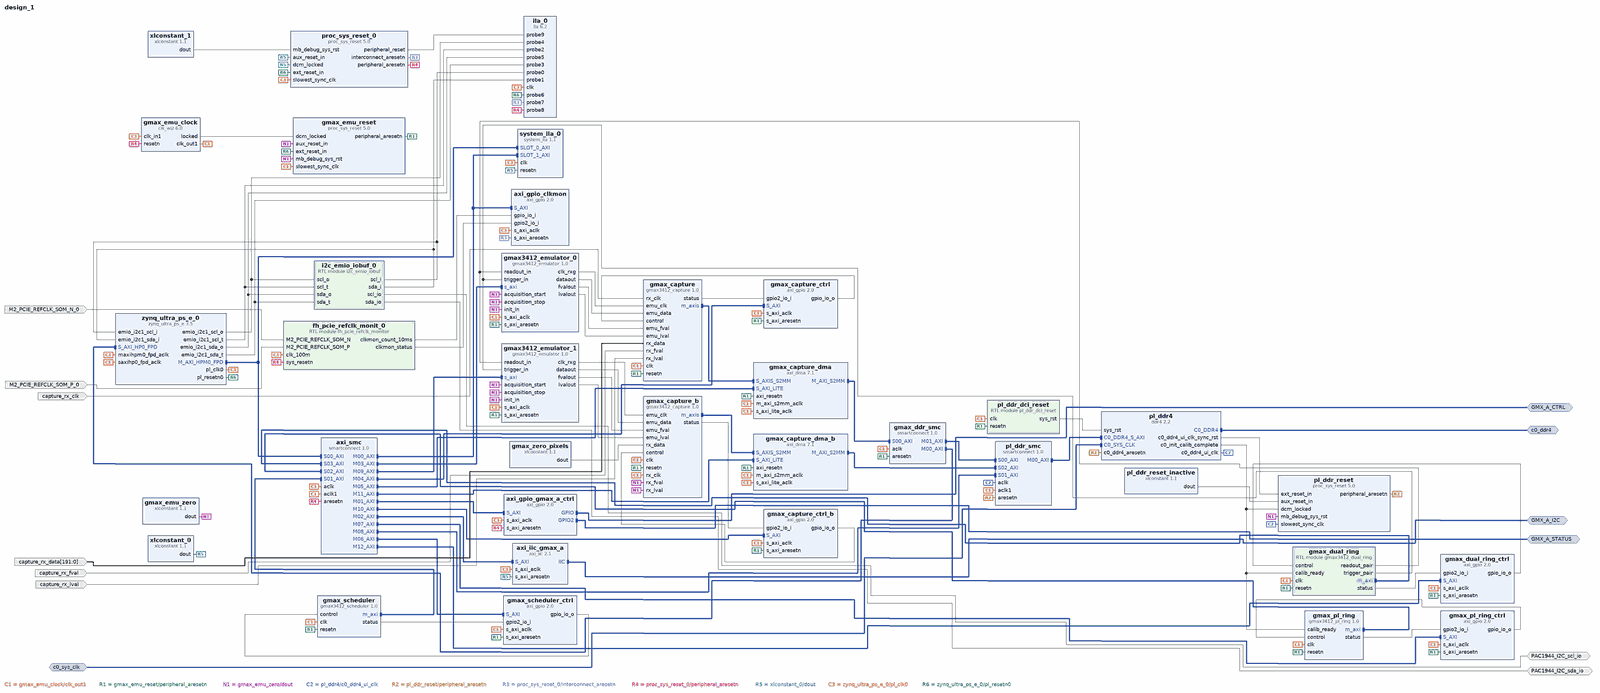
[diagram p0: block diagram of the top level, whole]
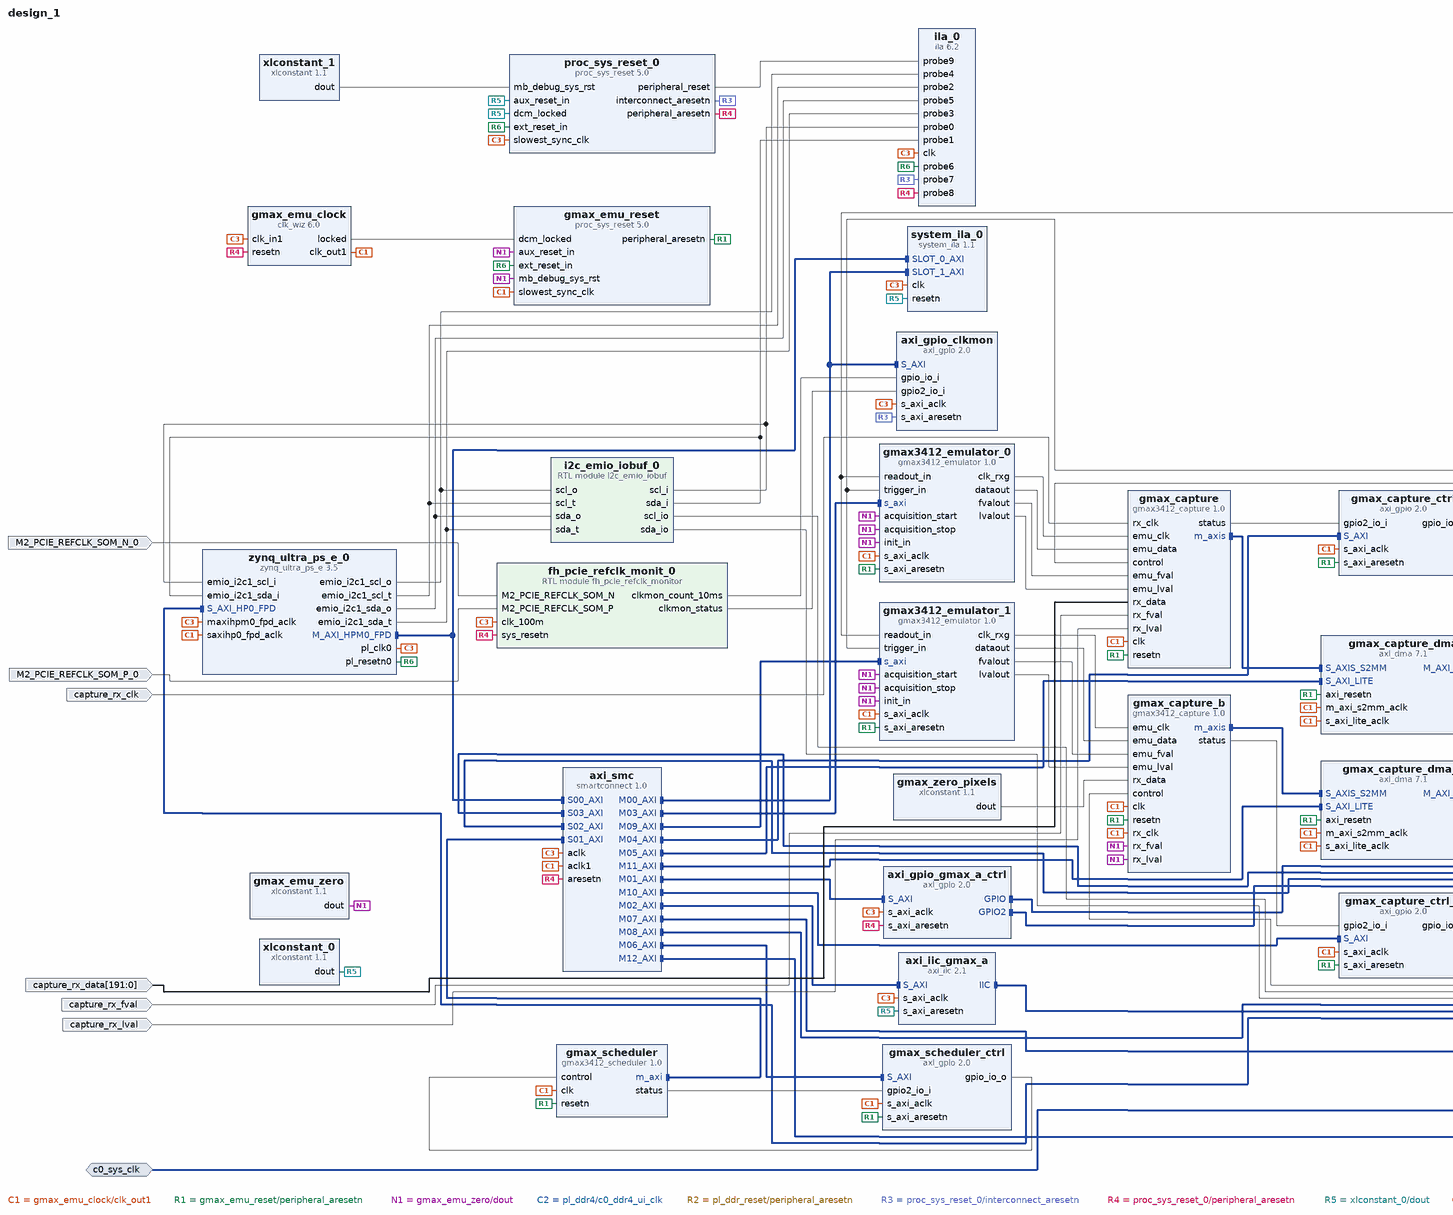
[diagram p1: block diagram of the top level, left part]
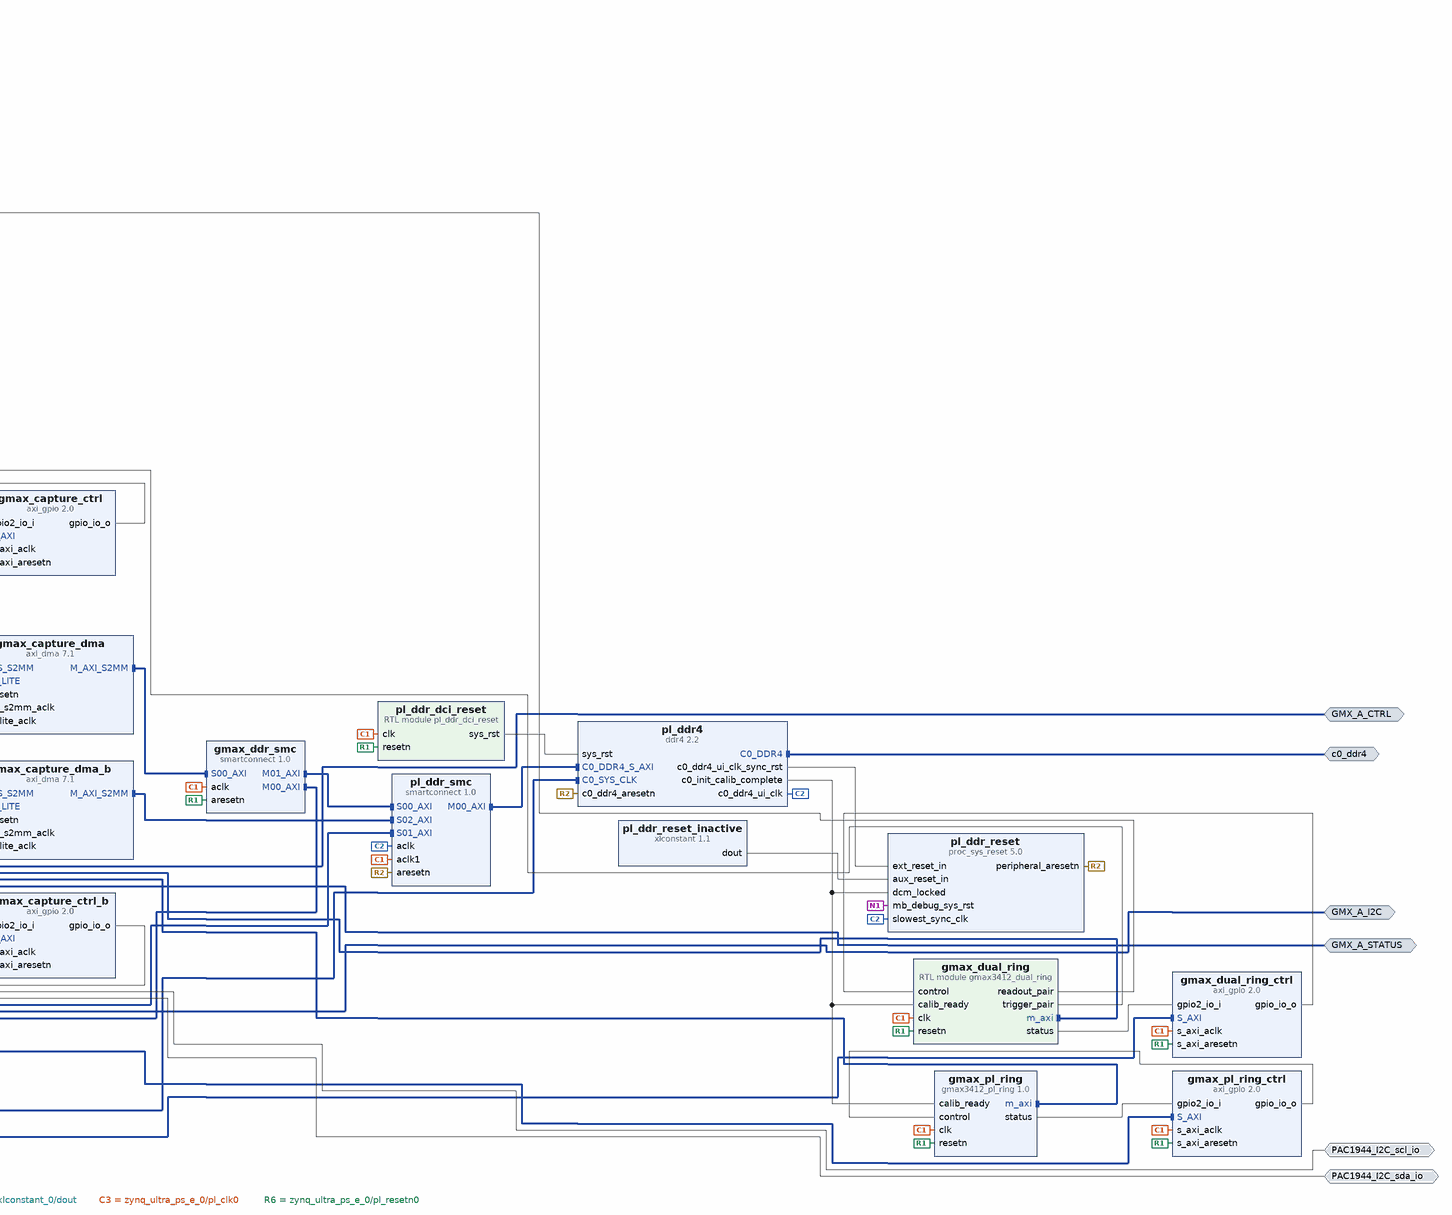
[diagram p2: block diagram of the top level, right part]
# Vivado block design design_1, xczu7ev-ffvc1156-2-i, Vivado 2025.2
create_bd_design design_1

create_bd_intf_port -mode Master -vlnv xilinx.com:interface:gpio_rtl:1.0 GMX_A_CTRL
create_bd_intf_port -mode Master -vlnv xilinx.com:interface:gpio_rtl:1.0 GMX_A_STATUS
create_bd_intf_port -mode Master -vlnv xilinx.com:interface:iic_rtl:1.0 GMX_A_I2C
create_bd_intf_port -mode Master -vlnv xilinx.com:interface:ddr4_rtl:1.0 c0_ddr4
create_bd_intf_port -mode Slave -vlnv xilinx.com:interface:diff_clock_rtl:1.0 c0_sys_clk
set_property -dict {CONFIG.FREQ_HZ 200080032} [get_bd_intf_ports c0_sys_clk]
create_bd_port -dir IO PAC1944_I2C_scl_io
create_bd_port -dir IO PAC1944_I2C_sda_io
create_bd_port -dir I M2_PCIE_REFCLK_SOM_P_0
create_bd_port -dir I M2_PCIE_REFCLK_SOM_N_0
create_bd_port -dir I -type clk capture_rx_clk
set_property -dict {CONFIG.FREQ_HZ 120000000} [get_bd_ports capture_rx_clk]
create_bd_port -dir I -type data capture_rx_fval
create_bd_port -dir I -type data capture_rx_lval
create_bd_port -dir I -from 191 -to 0 capture_rx_data

create_bd_cell -type ip -vlnv xilinx.com:ip:zynq_ultra_ps_e:3.5 zynq_ultra_ps_e_0
set_property -dict [list \
  CONFIG.CAN0_BOARD_INTERFACE custom \
  CONFIG.CAN1_BOARD_INTERFACE custom \
  CONFIG.CSU_BOARD_INTERFACE custom \
  CONFIG.DP_BOARD_INTERFACE custom \
  CONFIG.GEM0_BOARD_INTERFACE custom \
  CONFIG.GEM1_BOARD_INTERFACE custom \
  CONFIG.GEM2_BOARD_INTERFACE custom \
  CONFIG.GEM3_BOARD_INTERFACE custom \
  CONFIG.GPIO_BOARD_INTERFACE custom \
  CONFIG.IIC0_BOARD_INTERFACE custom \
  CONFIG.IIC1_BOARD_INTERFACE custom \
  CONFIG.NAND_BOARD_INTERFACE custom \
  CONFIG.PCIE_BOARD_INTERFACE custom \
  CONFIG.PJTAG_BOARD_INTERFACE custom \
  CONFIG.PMU_BOARD_INTERFACE custom \
  CONFIG.PSU_BANK_0_IO_STANDARD LVCMOS18 \
  CONFIG.PSU_BANK_1_IO_STANDARD LVCMOS18 \
  CONFIG.PSU_BANK_2_IO_STANDARD LVCMOS18 \
  CONFIG.PSU_BANK_3_IO_STANDARD LVCMOS18 \
  CONFIG.PSU_USB3__DUAL_CLOCK_ENABLE 1 \
  CONFIG.PSU__ACPU2__POWER__ON 0 \
  CONFIG.PSU__ACPU3__POWER__ON 0 \
  CONFIG.PSU__CAN1__PERIPHERAL__ENABLE 0 \
  CONFIG.PSU__CRF_APB__ACPU_CTRL__FREQMHZ 1200 \
  CONFIG.PSU__CRF_APB__ACPU_CTRL__SRCSEL APLL \
  CONFIG.PSU__CRF_APB__APLL_CTRL__SRCSEL PSS_REF_CLK \
  CONFIG.PSU__CRF_APB__DBG_FPD_CTRL__FREQMHZ 250 \
  CONFIG.PSU__CRF_APB__DBG_FPD_CTRL__SRCSEL IOPLL \
  CONFIG.PSU__CRF_APB__DBG_TRACE_CTRL__FREQMHZ 250 \
  CONFIG.PSU__CRF_APB__DBG_TRACE_CTRL__SRCSEL IOPLL \
  CONFIG.PSU__CRF_APB__DBG_TSTMP_CTRL__FREQMHZ 250 \
  CONFIG.PSU__CRF_APB__DBG_TSTMP_CTRL__SRCSEL IOPLL \
  CONFIG.PSU__CRF_APB__DDR_CTRL__FREQMHZ 1200 \
  CONFIG.PSU__CRF_APB__DDR_CTRL__SRCSEL DPLL \
  CONFIG.PSU__CRF_APB__DPDMA_REF_CTRL__FREQMHZ 600 \
  CONFIG.PSU__CRF_APB__DPDMA_REF_CTRL__SRCSEL DPLL \
  CONFIG.PSU__CRF_APB__DPLL_CTRL__SRCSEL PSS_REF_CLK \
  CONFIG.PSU__CRF_APB__DP_AUDIO_REF_CTRL__SRCSEL RPLL \
  CONFIG.PSU__CRF_APB__DP_STC_REF_CTRL__SRCSEL DPLL \
  CONFIG.PSU__CRF_APB__DP_VIDEO_REF_CTRL__SRCSEL VPLL \
  CONFIG.PSU__CRF_APB__GDMA_REF_CTRL__FREQMHZ 600 \
  CONFIG.PSU__CRF_APB__GDMA_REF_CTRL__SRCSEL DPLL \
  CONFIG.PSU__CRF_APB__GPU_REF_CTRL__FREQMHZ 600 \
  CONFIG.PSU__CRF_APB__GPU_REF_CTRL__SRCSEL DPLL \
  CONFIG.PSU__CRF_APB__TOPSW_LSBUS_CTRL__FREQMHZ 100 \
  CONFIG.PSU__CRF_APB__TOPSW_LSBUS_CTRL__SRCSEL IOPLL \
  CONFIG.PSU__CRF_APB__TOPSW_MAIN_CTRL__FREQMHZ 533.333 \
  CONFIG.PSU__CRF_APB__TOPSW_MAIN_CTRL__SRCSEL APLL \
  CONFIG.PSU__CRF_APB__VPLL_CTRL__SRCSEL PSS_REF_CLK \
  CONFIG.PSU__CRL_APB__ADMA_REF_CTRL__FREQMHZ 500 \
  CONFIG.PSU__CRL_APB__ADMA_REF_CTRL__SRCSEL IOPLL \
  CONFIG.PSU__CRL_APB__CAN1_REF_CTRL__FREQMHZ 100 \
  CONFIG.PSU__CRL_APB__CAN1_REF_CTRL__SRCSEL IOPLL \
  CONFIG.PSU__CRL_APB__CPU_R5_CTRL__FREQMHZ 500 \
  CONFIG.PSU__CRL_APB__CPU_R5_CTRL__SRCSEL IOPLL \
  CONFIG.PSU__CRL_APB__DBG_LPD_CTRL__FREQMHZ 250 \
  CONFIG.PSU__CRL_APB__DBG_LPD_CTRL__SRCSEL IOPLL \
  CONFIG.PSU__CRL_APB__GEM3_REF_CTRL__FREQMHZ 125 \
  CONFIG.PSU__CRL_APB__GEM3_REF_CTRL__SRCSEL IOPLL \
  CONFIG.PSU__CRL_APB__I2C0_REF_CTRL__FREQMHZ 100 \
  CONFIG.PSU__CRL_APB__I2C0_REF_CTRL__SRCSEL IOPLL \
  CONFIG.PSU__CRL_APB__I2C1_REF_CTRL__FREQMHZ 100 \
  CONFIG.PSU__CRL_APB__I2C1_REF_CTRL__SRCSEL IOPLL \
  CONFIG.PSU__CRL_APB__IOPLL_CTRL__SRCSEL PSS_REF_CLK \
  CONFIG.PSU__CRL_APB__IOU_SWITCH_CTRL__FREQMHZ 267 \
  CONFIG.PSU__CRL_APB__IOU_SWITCH_CTRL__SRCSEL RPLL \
  CONFIG.PSU__CRL_APB__LPD_LSBUS_CTRL__FREQMHZ 100 \
  CONFIG.PSU__CRL_APB__LPD_LSBUS_CTRL__SRCSEL IOPLL \
  CONFIG.PSU__CRL_APB__LPD_SWITCH_CTRL__FREQMHZ 500 \
  CONFIG.PSU__CRL_APB__LPD_SWITCH_CTRL__SRCSEL IOPLL \
  CONFIG.PSU__CRL_APB__PCAP_CTRL__FREQMHZ 200 \
  CONFIG.PSU__CRL_APB__PCAP_CTRL__SRCSEL IOPLL \
  CONFIG.PSU__CRL_APB__PL0_REF_CTRL__FREQMHZ 100 \
  CONFIG.PSU__CRL_APB__PL0_REF_CTRL__SRCSEL RPLL \
  CONFIG.PSU__CRL_APB__QSPI_REF_CTRL__FREQMHZ 125 \
  CONFIG.PSU__CRL_APB__QSPI_REF_CTRL__SRCSEL IOPLL \
  CONFIG.PSU__CRL_APB__RPLL_CTRL__SRCSEL PSS_REF_CLK \
  CONFIG.PSU__CRL_APB__SDIO0_REF_CTRL__FREQMHZ 100 \
  CONFIG.PSU__CRL_APB__SDIO0_REF_CTRL__SRCSEL IOPLL \
  CONFIG.PSU__CRL_APB__SDIO1_REF_CTRL__FREQMHZ 100 \
  CONFIG.PSU__CRL_APB__SDIO1_REF_CTRL__SRCSEL IOPLL \
  CONFIG.PSU__CRL_APB__TIMESTAMP_REF_CTRL__FREQMHZ 100 \
  CONFIG.PSU__CRL_APB__TIMESTAMP_REF_CTRL__SRCSEL PSS_REF_CLK \
  CONFIG.PSU__CRL_APB__UART0_REF_CTRL__FREQMHZ 100 \
  CONFIG.PSU__CRL_APB__UART0_REF_CTRL__SRCSEL IOPLL \
  CONFIG.PSU__CRL_APB__UART1_REF_CTRL__FREQMHZ 100 \
  CONFIG.PSU__CRL_APB__UART1_REF_CTRL__SRCSEL IOPLL \
  CONFIG.PSU__CRL_APB__USB0_BUS_REF_CTRL__FREQMHZ 250 \
  CONFIG.PSU__CRL_APB__USB0_BUS_REF_CTRL__SRCSEL IOPLL \
  CONFIG.PSU__CRL_APB__USB3_DUAL_REF_CTRL__FREQMHZ 20 \
  CONFIG.PSU__CRL_APB__USB3_DUAL_REF_CTRL__SRCSEL IOPLL \
  CONFIG.PSU__CRL_APB__USB3__ENABLE 1 \
  CONFIG.PSU__CSUPMU__PERIPHERAL__VALID 0 \
  CONFIG.PSU__DDRC__BUS_WIDTH {64 Bit} \
  CONFIG.PSU__DDRC__COMPONENTS Components \
  CONFIG.PSU__DDRC__DEVICE_CAPACITY {8192 MBits} \
  CONFIG.PSU__DDRC__DRAM_WIDTH {16 Bits} \
  CONFIG.PSU__DDRC__ECC Disabled \
  CONFIG.PSU__DDRC__MEMORY_TYPE {DDR 4} \
  CONFIG.PSU__DDRC__SPEED_BIN DDR4_2400P \
  CONFIG.PSU__DDR_HIGH_ADDRESS_GUI_ENABLE 1 \
  CONFIG.PSU__DDR__INTERFACE__FREQMHZ 600.000 \
  CONFIG.PSU__DEVICE_TYPE EV \
  CONFIG.PSU__DISPLAYPORT__PERIPHERAL__ENABLE 0 \
  CONFIG.PSU__DLL__ISUSED 1 \
  CONFIG.PSU__ENET0__GRP_MDIO__ENABLE 1 \
  CONFIG.PSU__ENET0__GRP_MDIO__IO {MIO 76 .. 77} \
  CONFIG.PSU__ENET0__PERIPHERAL__ENABLE 1 \
  CONFIG.PSU__ENET0__PERIPHERAL__IO {MIO 26 .. 37} \
  CONFIG.PSU__ENET3__PERIPHERAL__ENABLE 0 \
  CONFIG.PSU__FPD_SLCR__WDT1__FREQMHZ 100 \
  CONFIG.PSU__FPGA_PL0_ENABLE 1 \
  CONFIG.PSU__GEM__TSU__ENABLE 0 \
  CONFIG.PSU__GPIO0_MIO__PERIPHERAL__ENABLE 0 \
  CONFIG.PSU__GPIO1_MIO__IO {MIO 26 .. 51} \
  CONFIG.PSU__GPIO1_MIO__PERIPHERAL__ENABLE 1 \
  CONFIG.PSU__GPIO2_MIO__IO {MIO 52 .. 77} \
  CONFIG.PSU__GPIO2_MIO__PERIPHERAL__ENABLE 1 \
  CONFIG.PSU__GPIO_EMIO_WIDTH 95 \
  CONFIG.PSU__GPU_PP0__POWER__ON 0 \
  CONFIG.PSU__GPU_PP1__POWER__ON 0 \
  CONFIG.PSU__I2C0__PERIPHERAL__ENABLE 1 \
  CONFIG.PSU__I2C0__PERIPHERAL__IO {MIO 74 .. 75} \
  CONFIG.PSU__I2C1__PERIPHERAL__ENABLE 1 \
  CONFIG.PSU__I2C1__PERIPHERAL__IO EMIO \
  CONFIG.PSU__IOU_SLCR__IOU_TTC_APB_CLK__TTC0_SEL APB \
  CONFIG.PSU__IOU_SLCR__IOU_TTC_APB_CLK__TTC1_SEL APB \
  CONFIG.PSU__IOU_SLCR__IOU_TTC_APB_CLK__TTC2_SEL APB \
  CONFIG.PSU__IOU_SLCR__IOU_TTC_APB_CLK__TTC3_SEL APB \
  CONFIG.PSU__IOU_SLCR__WDT0__FREQMHZ 100 \
  CONFIG.PSU__IRQ_P2F_USB2_OTG__INT0 0 \
  CONFIG.PSU__IRQ_P2F_USB2_OTG__INT1 0 \
  CONFIG.PSU__LPD_SLCR__CSUPMU__FREQMHZ 100 \
  CONFIG.PSU__MAXIGP0__DATA_WIDTH 32 \
  CONFIG.PSU__OVERRIDE_HPX_QOS 0 \
  CONFIG.PSU__OVERRIDE__BASIC_CLOCK 0 \
  CONFIG.PSU__PCIE__CLASS_CODE_BASE 0x06 \
  CONFIG.PSU__PCIE__CLASS_CODE_INTERFACE 0x0 \
  CONFIG.PSU__PCIE__CLASS_CODE_SUB 0x04 \
  CONFIG.PSU__PCIE__DEVICE_ID 0xD011 \
  CONFIG.PSU__PCIE__INTX_GENERATION 1 \
  CONFIG.PSU__PCIE__REVISION_ID 0x0 \
  CONFIG.PSU__PCIE__SUBSYSTEM_ID 0x7 \
  CONFIG.PSU__PCIE__SUBSYSTEM_VENDOR_ID 0x10EE \
  CONFIG.PSU__PCIE__VENDOR_ID 0x10EE \
  CONFIG.PSU__PMU__PERIPHERAL__ENABLE 0 \
  CONFIG.PSU__PRESET_APPLIED 0 \
  CONFIG.PSU__PSS_REF_CLK__FREQMHZ 33.333333 \
  CONFIG.PSU__QSPI_COHERENCY 0 \
  CONFIG.PSU__QSPI_ROUTE_THROUGH_FPD 0 \
  CONFIG.PSU__QSPI__GRP_FBCLK__ENABLE 0 \
  CONFIG.PSU__QSPI__PERIPHERAL__DATA_MODE x4 \
  CONFIG.PSU__QSPI__PERIPHERAL__ENABLE 1 \
  CONFIG.PSU__QSPI__PERIPHERAL__IO {MIO 0 .. 5} \
  CONFIG.PSU__QSPI__PERIPHERAL__MODE Single \
  CONFIG.PSU__SATA__LANE0__ENABLE 1 \
  CONFIG.PSU__SATA__LANE0__IO {GT Lane0} \
  CONFIG.PSU__SATA__LANE1__ENABLE 0 \
  CONFIG.PSU__SATA__PERIPHERAL__ENABLE 1 \
  CONFIG.PSU__SATA__REF_CLK_FREQ 150 \
  CONFIG.PSU__SATA__REF_CLK_SEL {Ref Clk0} \
  CONFIG.PSU__SD0__CLK_200_SDR_OTAP_DLY 0x3 \
  CONFIG.PSU__SD0__CLK_50_DDR_ITAP_DLY 0x12 \
  CONFIG.PSU__SD0__CLK_50_DDR_OTAP_DLY 0x6 \
  CONFIG.PSU__SD0__CLK_50_SDR_ITAP_DLY 0x15 \
  CONFIG.PSU__SD0__CLK_50_SDR_OTAP_DLY 0x6 \
  CONFIG.PSU__SD0__DATA_TRANSFER_MODE 8Bit \
  CONFIG.PSU__SD0__GRP_POW__ENABLE 1 \
  CONFIG.PSU__SD0__GRP_POW__IO {MIO 23} \
  CONFIG.PSU__SD0__PERIPHERAL__ENABLE 1 \
  CONFIG.PSU__SD0__PERIPHERAL__IO {MIO 13 .. 22} \
  CONFIG.PSU__SD0__RESET__ENABLE 1 \
  CONFIG.PSU__SD0__SLOT_TYPE eMMC \
  CONFIG.PSU__SD1__CLK_100_SDR_OTAP_DLY 0x0 \
  CONFIG.PSU__SD1__CLK_200_SDR_OTAP_DLY 0x0 \
  CONFIG.PSU__SD1__CLK_50_DDR_ITAP_DLY 0x0 \
  CONFIG.PSU__SD1__CLK_50_DDR_OTAP_DLY 0x0 \
  CONFIG.PSU__SD1__CLK_50_SDR_ITAP_DLY 0x15 \
  CONFIG.PSU__SD1__CLK_50_SDR_OTAP_DLY 0x5 \
  CONFIG.PSU__SD1__PERIPHERAL__ENABLE 0 \
  CONFIG.PSU__SWDT0__PERIPHERAL__ENABLE 0 \
  CONFIG.PSU__SWDT1__PERIPHERAL__ENABLE 0 \
  CONFIG.PSU__TSU__BUFG_PORT_PAIR 0 \
  CONFIG.PSU__TTC0__CLOCK__ENABLE 0 \
  CONFIG.PSU__TTC0__PERIPHERAL__ENABLE 1 \
  CONFIG.PSU__TTC0__WAVEOUT__ENABLE 0 \
  CONFIG.PSU__TTC1__CLOCK__ENABLE 0 \
  CONFIG.PSU__TTC1__PERIPHERAL__ENABLE 1 \
  CONFIG.PSU__TTC1__WAVEOUT__ENABLE 0 \
  CONFIG.PSU__TTC2__CLOCK__ENABLE 0 \
  CONFIG.PSU__TTC2__PERIPHERAL__ENABLE 1 \
  CONFIG.PSU__TTC2__WAVEOUT__ENABLE 0 \
  CONFIG.PSU__TTC3__CLOCK__ENABLE 0 \
  CONFIG.PSU__TTC3__PERIPHERAL__ENABLE 1 \
  CONFIG.PSU__TTC3__WAVEOUT__ENABLE 0 \
  CONFIG.PSU__UART0__BAUD_RATE 115200 \
  CONFIG.PSU__UART0__MODEM__ENABLE 0 \
  CONFIG.PSU__UART0__PERIPHERAL__ENABLE 1 \
  CONFIG.PSU__UART0__PERIPHERAL__IO {MIO 42 .. 43} \
  CONFIG.PSU__UART1__PERIPHERAL__ENABLE 0 \
  CONFIG.PSU__USB0_COHERENCY 0 \
  CONFIG.PSU__USB0__PERIPHERAL__ENABLE 1 \
  CONFIG.PSU__USB0__PERIPHERAL__IO {MIO 52 .. 63} \
  CONFIG.PSU__USB0__REF_CLK_FREQ 100 \
  CONFIG.PSU__USB0__REF_CLK_SEL {Ref Clk1} \
  CONFIG.PSU__USB2_0__EMIO__ENABLE 0 \
  CONFIG.PSU__USB3_0__EMIO__ENABLE 0 \
  CONFIG.PSU__USB3_0__PERIPHERAL__ENABLE 1 \
  CONFIG.PSU__USB3_0__PERIPHERAL__IO {GT Lane1} \
  CONFIG.PSU__USB__RESET__MODE {Boot Pin} \
  CONFIG.PSU__USB__RESET__POLARITY {Active Low} \
  CONFIG.PSU__USE__IRQ0 0 \
  CONFIG.PSU__USE__M_AXI_GP0 1 \
  CONFIG.PSU__USE__M_AXI_GP1 0 \
  CONFIG.PSU__USE__M_AXI_GP2 0 \
  CONFIG.PSU__USE__S_AXI_GP2 1 \
  CONFIG.QSPI_BOARD_INTERFACE custom \
  CONFIG.SATA_BOARD_INTERFACE custom \
  CONFIG.SD0_BOARD_INTERFACE custom \
  CONFIG.SD1_BOARD_INTERFACE custom \
  CONFIG.SPI0_BOARD_INTERFACE custom \
  CONFIG.SPI1_BOARD_INTERFACE custom \
  CONFIG.SUBPRESET1 Custom \
  CONFIG.SUBPRESET2 Custom \
  CONFIG.SWDT0_BOARD_INTERFACE custom \
  CONFIG.SWDT1_BOARD_INTERFACE custom \
  CONFIG.TRACE_BOARD_INTERFACE custom \
  CONFIG.TTC0_BOARD_INTERFACE custom \
  CONFIG.TTC1_BOARD_INTERFACE custom \
  CONFIG.TTC2_BOARD_INTERFACE custom \
  CONFIG.TTC3_BOARD_INTERFACE custom \
  CONFIG.UART0_BOARD_INTERFACE custom \
  CONFIG.UART1_BOARD_INTERFACE custom \
  CONFIG.USB0_BOARD_INTERFACE custom \
  CONFIG.USB1_BOARD_INTERFACE custom \
  CONFIG.preset None \
] [get_bd_cells zynq_ultra_ps_e_0]
# 763 more settings of zynq_ultra_ps_e_0 are not shown: defaults, MIO pin electricals, DDR timing, and values the tool derives
create_bd_cell -type ip -vlnv xilinx.com:ip:ila:6.2 ila_0
set_property -dict {CONFIG.C_DATA_DEPTH 65536 CONFIG.C_MONITOR_TYPE Native CONFIG.C_NUM_OF_PROBES 10} [get_bd_cells ila_0]
create_bd_cell -type module -reference i2c_emio_iobuf i2c_emio_iobuf_0
create_bd_cell -type module -reference fh_pcie_refclk_monitor fh_pcie_refclk_monit_0
create_bd_cell -type ip -vlnv xilinx.com:ip:proc_sys_reset:5.0 proc_sys_reset_0
set_property -dict [list \
  CONFIG.C_AUX_RST_WIDTH 1 \
  CONFIG.C_NUM_INTERCONNECT_ARESETN 1 \
  CONFIG.C_NUM_PERP_RST 1 \
] [get_bd_cells proc_sys_reset_0]
create_bd_cell -type ip -vlnv xilinx.com:ip:axi_gpio:2.0 axi_gpio_clkmon
set_property -dict {CONFIG.C_ALL_INPUTS 1 CONFIG.C_ALL_INPUTS_2 1 CONFIG.C_IS_DUAL 1} [get_bd_cells axi_gpio_clkmon]
create_bd_cell -type ip -vlnv xilinx.com:ip:smartconnect:1.0 axi_smc
set_property -dict {CONFIG.NUM_CLKS 2 CONFIG.NUM_MI 13 CONFIG.NUM_SI 4} [get_bd_cells axi_smc]
create_bd_cell -type ip -vlnv xilinx.com:ip:xlconstant:1.1 xlconstant_0
set_property -dict {CONFIG.CONST_VAL 1} [get_bd_cells xlconstant_0]
create_bd_cell -type ip -vlnv xilinx.com:ip:xlconstant:1.1 xlconstant_1
set_property -dict {CONFIG.CONST_VAL 0} [get_bd_cells xlconstant_1]
create_bd_cell -type ip -vlnv xilinx.com:ip:system_ila:1.1 system_ila_0
set_property -dict [list \
  CONFIG.C_ADV_TRIGGER false \
  CONFIG.C_DATA_DEPTH 4096 \
  CONFIG.C_EN_STRG_QUAL 0 \
  CONFIG.C_NUM_MONITOR_SLOTS 2 \
  CONFIG.C_SLOT 1 \
] [get_bd_cells system_ila_0]
create_bd_cell -type ip -vlnv xilinx.com:ip:axi_gpio:2.0 axi_gpio_gmax_a_ctrl
set_property -dict [list \
  CONFIG.C_ALL_INPUTS_2 1 \
  CONFIG.C_ALL_OUTPUTS 1 \
  CONFIG.C_DOUT_DEFAULT 0x00000008 \
  CONFIG.C_GPIO2_WIDTH 32 \
  CONFIG.C_GPIO_WIDTH 15 \
  CONFIG.C_IS_DUAL 1 \
] [get_bd_cells axi_gpio_gmax_a_ctrl]
create_bd_cell -type ip -vlnv xilinx.com:ip:axi_iic:2.1 axi_iic_gmax_a
create_bd_cell -type ip -vlnv fh.local:user:gmax3412_emulator:1.0 gmax3412_emulator_0
set_property -dict {CONFIG.LANES 16} [get_bd_cells gmax3412_emulator_0]
create_bd_cell -type ip -vlnv xilinx.com:ip:clk_wiz:6.0 gmax_emu_clock
set_property -dict [list \
  CONFIG.CLKOUT1_REQUESTED_OUT_FREQ 120.000 \
  CONFIG.PRIM_IN_FREQ 100.000 \
  CONFIG.PRIM_SOURCE No_buffer \
  CONFIG.RESET_TYPE ACTIVE_LOW \
] [get_bd_cells gmax_emu_clock]
create_bd_cell -type ip -vlnv xilinx.com:ip:proc_sys_reset:5.0 gmax_emu_reset
set_property -dict {CONFIG.C_AUX_RESET_HIGH 1} [get_bd_cells gmax_emu_reset]
create_bd_cell -type ip -vlnv xilinx.com:ip:xlconstant:1.1 gmax_emu_zero
set_property -dict {CONFIG.CONST_VAL 0} [get_bd_cells gmax_emu_zero]
create_bd_cell -type ip -vlnv fh.local:user:gmax3412_capture:1.0 gmax_capture
set_property -dict {CONFIG.AXIS_WIDTH 256 CONFIG.DEPTH 4096 CONFIG.LANES 16} [get_bd_cells gmax_capture]
create_bd_cell -type ip -vlnv xilinx.com:ip:axi_gpio:2.0 gmax_capture_ctrl
set_property -dict [list \
  CONFIG.C_ALL_INPUTS_2 1 \
  CONFIG.C_ALL_OUTPUTS 1 \
  CONFIG.C_GPIO2_WIDTH 32 \
  CONFIG.C_GPIO_WIDTH 32 \
  CONFIG.C_IS_DUAL 1 \
] [get_bd_cells gmax_capture_ctrl]
create_bd_cell -type ip -vlnv xilinx.com:ip:axi_dma:7.1 gmax_capture_dma
set_property -dict [list \
  CONFIG.c_addr_width 64 \
  CONFIG.c_include_mm2s 0 \
  CONFIG.c_include_s2mm 1 \
  CONFIG.c_include_sg 0 \
  CONFIG.c_m_axi_s2mm_data_width 256 \
  CONFIG.c_s2mm_burst_size 64 \
  CONFIG.c_s_axis_s2mm_tdata_width 256 \
  CONFIG.c_sg_length_width 26 \
] [get_bd_cells gmax_capture_dma]
create_bd_cell -type ip -vlnv xilinx.com:ip:smartconnect:1.0 gmax_ddr_smc
set_property -dict {CONFIG.NUM_MI 2 CONFIG.NUM_SI 1} [get_bd_cells gmax_ddr_smc]
create_bd_cell -type ip -vlnv fh.local:user:gmax3412_scheduler:1.0 gmax_scheduler
create_bd_cell -type ip -vlnv xilinx.com:ip:axi_gpio:2.0 gmax_scheduler_ctrl
set_property -dict [list \
  CONFIG.C_ALL_INPUTS_2 1 \
  CONFIG.C_ALL_OUTPUTS 1 \
  CONFIG.C_GPIO2_WIDTH 32 \
  CONFIG.C_GPIO_WIDTH 32 \
  CONFIG.C_IS_DUAL 1 \
] [get_bd_cells gmax_scheduler_ctrl]
create_bd_cell -type ip -vlnv xilinx.com:ip:ddr4:2.2 pl_ddr4
set_property -dict [list \
  CONFIG.C0.DDR4_AxiAddressWidth 32 \
  CONFIG.C0.DDR4_AxiDataWidth 512 \
  CONFIG.C0.DDR4_AxiNarrowBurst true \
  CONFIG.C0.DDR4_CasLatency 17 \
  CONFIG.C0.DDR4_CasWriteLatency 12 \
  CONFIG.C0.DDR4_DataMask DM_NO_DBI \
  CONFIG.C0.DDR4_DataWidth 64 \
  CONFIG.C0.DDR4_InputClockPeriod 4998 \
  CONFIG.C0.DDR4_MemoryPart MT40A512M16LY-075 \
  CONFIG.C0.DDR4_TimePeriod 833 \
] [get_bd_cells pl_ddr4]
create_bd_cell -type ip -vlnv xilinx.com:ip:proc_sys_reset:5.0 pl_ddr_reset
set_property -dict {CONFIG.C_AUX_RESET_HIGH 0} [get_bd_cells pl_ddr_reset]
create_bd_cell -type ip -vlnv xilinx.com:ip:smartconnect:1.0 pl_ddr_smc
set_property -dict {CONFIG.NUM_CLKS 2 CONFIG.NUM_MI 1 CONFIG.NUM_SI 3} [get_bd_cells pl_ddr_smc]
create_bd_cell -type ip -vlnv fh.local:user:gmax3412_pl_ring:1.0 gmax_pl_ring
create_bd_cell -type ip -vlnv xilinx.com:ip:axi_gpio:2.0 gmax_pl_ring_ctrl
set_property -dict [list \
  CONFIG.C_ALL_INPUTS_2 1 \
  CONFIG.C_ALL_OUTPUTS 1 \
  CONFIG.C_GPIO2_WIDTH 32 \
  CONFIG.C_GPIO_WIDTH 32 \
  CONFIG.C_IS_DUAL 1 \
] [get_bd_cells gmax_pl_ring_ctrl]
create_bd_cell -type module -reference pl_ddr_dci_reset pl_ddr_dci_reset
create_bd_cell -type ip -vlnv xilinx.com:ip:xlconstant:1.1 pl_ddr_reset_inactive
set_property -dict {CONFIG.CONST_VAL 1 CONFIG.CONST_WIDTH 1} [get_bd_cells pl_ddr_reset_inactive]
create_bd_cell -type module -reference gmax3412_dual_ring gmax_dual_ring
create_bd_cell -type ip -vlnv fh.local:user:gmax3412_emulator:1.0 gmax3412_emulator_1
set_property -dict {CONFIG.LANES 16} [get_bd_cells gmax3412_emulator_1]
create_bd_cell -type ip -vlnv fh.local:user:gmax3412_capture:1.0 gmax_capture_b
set_property -dict {CONFIG.AXIS_WIDTH 256 CONFIG.DEPTH 4096 CONFIG.LANES 16} [get_bd_cells gmax_capture_b]
create_bd_cell -type ip -vlnv xilinx.com:ip:axi_dma:7.1 gmax_capture_dma_b
set_property -dict [list \
  CONFIG.c_addr_width 64 \
  CONFIG.c_include_mm2s 0 \
  CONFIG.c_include_s2mm 1 \
  CONFIG.c_include_sg 0 \
  CONFIG.c_m_axi_s2mm_data_width 256 \
  CONFIG.c_s2mm_burst_size 64 \
  CONFIG.c_s_axis_s2mm_tdata_width 256 \
  CONFIG.c_sg_length_width 26 \
] [get_bd_cells gmax_capture_dma_b]
create_bd_cell -type ip -vlnv xilinx.com:ip:axi_gpio:2.0 gmax_capture_ctrl_b
set_property -dict [list \
  CONFIG.C_ALL_INPUTS_2 1 \
  CONFIG.C_ALL_OUTPUTS 1 \
  CONFIG.C_GPIO2_WIDTH 32 \
  CONFIG.C_GPIO_WIDTH 32 \
  CONFIG.C_IS_DUAL 1 \
] [get_bd_cells gmax_capture_ctrl_b]
create_bd_cell -type ip -vlnv xilinx.com:ip:axi_gpio:2.0 gmax_dual_ring_ctrl
set_property -dict [list \
  CONFIG.C_ALL_INPUTS_2 1 \
  CONFIG.C_ALL_OUTPUTS 1 \
  CONFIG.C_GPIO2_WIDTH 32 \
  CONFIG.C_GPIO_WIDTH 32 \
  CONFIG.C_IS_DUAL 1 \
] [get_bd_cells gmax_dual_ring_ctrl]
create_bd_cell -type ip -vlnv xilinx.com:ip:xlconstant:1.1 gmax_zero_pixels
set_property -dict {CONFIG.CONST_VAL 0 CONFIG.CONST_WIDTH 192} [get_bd_cells gmax_zero_pixels]

# ---- connections ----

connect_bd_intf_net -intf_net C0_SYS_CLK_0_1 [get_bd_intf_ports c0_sys_clk] [get_bd_intf_pins pl_ddr4/C0_SYS_CLK]
connect_bd_intf_net -intf_net axi_gpio_0_GPIO [get_bd_intf_ports GMX_A_CTRL] [get_bd_intf_pins axi_gpio_gmax_a_ctrl/GPIO]
connect_bd_intf_net -intf_net axi_gpio_0_GPIO2 [get_bd_intf_ports GMX_A_STATUS] [get_bd_intf_pins axi_gpio_gmax_a_ctrl/GPIO2]
connect_bd_intf_net [get_bd_intf_ports GMX_A_I2C] [get_bd_intf_pins axi_iic_gmax_a/IIC]
connect_bd_intf_net [get_bd_intf_pins axi_smc/M00_AXI] [get_bd_intf_pins axi_gpio_clkmon/S_AXI]
connect_bd_intf_net [get_bd_intf_pins axi_smc/M00_AXI] [get_bd_intf_pins system_ila_0/SLOT_1_AXI]
connect_bd_intf_net [get_bd_intf_pins axi_gpio_gmax_a_ctrl/S_AXI] [get_bd_intf_pins axi_smc/M01_AXI]
connect_bd_intf_net [get_bd_intf_pins axi_smc/M02_AXI] [get_bd_intf_pins axi_iic_gmax_a/S_AXI]
connect_bd_intf_net [get_bd_intf_pins axi_smc/M03_AXI] [get_bd_intf_pins gmax3412_emulator_0/s_axi]
connect_bd_intf_net [get_bd_intf_pins axi_smc/M04_AXI] [get_bd_intf_pins gmax_capture_ctrl/S_AXI]
connect_bd_intf_net [get_bd_intf_pins axi_smc/M05_AXI] [get_bd_intf_pins gmax_capture_dma/S_AXI_LITE]
connect_bd_intf_net [get_bd_intf_pins axi_smc/M06_AXI] [get_bd_intf_pins gmax_scheduler_ctrl/S_AXI]
connect_bd_intf_net [get_bd_intf_pins axi_smc/M07_AXI] [get_bd_intf_pins gmax_pl_ring_ctrl/S_AXI]
connect_bd_intf_net [get_bd_intf_pins axi_smc/M08_AXI] [get_bd_intf_pins pl_ddr_smc/S01_AXI]
connect_bd_intf_net [get_bd_intf_pins axi_smc/M09_AXI] [get_bd_intf_pins gmax3412_emulator_1/s_axi]
connect_bd_intf_net [get_bd_intf_pins axi_smc/M10_AXI] [get_bd_intf_pins gmax_capture_ctrl_b/S_AXI]
connect_bd_intf_net [get_bd_intf_pins axi_smc/M11_AXI] [get_bd_intf_pins gmax_capture_dma_b/S_AXI_LITE]
connect_bd_intf_net [get_bd_intf_pins axi_smc/M12_AXI] [get_bd_intf_pins gmax_dual_ring_ctrl/S_AXI]
connect_bd_intf_net [get_bd_intf_pins gmax_capture_b/m_axis] [get_bd_intf_pins gmax_capture_dma_b/S_AXIS_S2MM]
connect_bd_intf_net [get_bd_intf_pins gmax_capture_dma/M_AXI_S2MM] [get_bd_intf_pins gmax_ddr_smc/S00_AXI]
connect_bd_intf_net [get_bd_intf_pins gmax_capture_dma_b/M_AXI_S2MM] [get_bd_intf_pins pl_ddr_smc/S02_AXI]
connect_bd_intf_net [get_bd_intf_pins gmax_capture/m_axis] [get_bd_intf_pins gmax_capture_dma/S_AXIS_S2MM]
connect_bd_intf_net [get_bd_intf_pins gmax_ddr_smc/M00_AXI] [get_bd_intf_pins zynq_ultra_ps_e_0/S_AXI_HP0_FPD]
connect_bd_intf_net [get_bd_intf_pins gmax_ddr_smc/M01_AXI] [get_bd_intf_pins pl_ddr_smc/S00_AXI]
connect_bd_intf_net [get_bd_intf_pins gmax_dual_ring/m_axi] [get_bd_intf_pins axi_smc/S03_AXI]
connect_bd_intf_net [get_bd_intf_pins axi_smc/S02_AXI] [get_bd_intf_pins gmax_pl_ring/m_axi]
connect_bd_intf_net [get_bd_intf_pins axi_smc/S01_AXI] [get_bd_intf_pins gmax_scheduler/m_axi]
connect_bd_intf_net [get_bd_intf_ports c0_ddr4] [get_bd_intf_pins pl_ddr4/C0_DDR4]
connect_bd_intf_net [get_bd_intf_pins pl_ddr_smc/M00_AXI] [get_bd_intf_pins pl_ddr4/C0_DDR4_S_AXI]
connect_bd_intf_net [get_bd_intf_pins zynq_ultra_ps_e_0/M_AXI_HPM0_FPD] [get_bd_intf_pins axi_smc/S00_AXI]
connect_bd_intf_net [get_bd_intf_pins zynq_ultra_ps_e_0/M_AXI_HPM0_FPD] [get_bd_intf_pins system_ila_0/SLOT_0_AXI]
connect_bd_net -net M2_PCIE_REFCLK_SOM_N_0_1 [get_bd_ports M2_PCIE_REFCLK_SOM_N_0] [get_bd_pins fh_pcie_refclk_monit_0/M2_PCIE_REFCLK_SOM_N]
connect_bd_net -net M2_PCIE_REFCLK_SOM_P_0_1 [get_bd_ports M2_PCIE_REFCLK_SOM_P_0] [get_bd_pins fh_pcie_refclk_monit_0/M2_PCIE_REFCLK_SOM_P]
connect_bd_net [get_bd_pins i2c_emio_iobuf_0/scl_i] [get_bd_pins zynq_ultra_ps_e_0/emio_i2c1_scl_i] [get_bd_pins ila_0/probe0]
connect_bd_net [get_bd_pins i2c_emio_iobuf_0/sda_i] [get_bd_pins zynq_ultra_ps_e_0/emio_i2c1_sda_i] [get_bd_pins ila_0/probe1]
connect_bd_net [get_bd_ports PAC1944_I2C_scl_io] [get_bd_pins i2c_emio_iobuf_0/scl_io]
connect_bd_net [get_bd_ports PAC1944_I2C_sda_io] [get_bd_pins i2c_emio_iobuf_0/sda_io]
connect_bd_net [get_bd_ports capture_rx_clk] [get_bd_pins gmax_capture/rx_clk]
connect_bd_net [get_bd_ports capture_rx_data] [get_bd_pins gmax_capture/rx_data]
connect_bd_net [get_bd_ports capture_rx_fval] [get_bd_pins gmax_capture/rx_fval]
connect_bd_net [get_bd_ports capture_rx_lval] [get_bd_pins gmax_capture/rx_lval]
connect_bd_net [get_bd_pins fh_pcie_refclk_monit_0/clkmon_count_10ms] [get_bd_pins axi_gpio_clkmon/gpio_io_i]
connect_bd_net [get_bd_pins fh_pcie_refclk_monit_0/clkmon_status] [get_bd_pins axi_gpio_clkmon/gpio2_io_i]
connect_bd_net [get_bd_pins gmax3412_emulator_0/clk_rxg] [get_bd_pins gmax_capture/emu_clk]
connect_bd_net [get_bd_pins gmax3412_emulator_0/dataout] [get_bd_pins gmax_capture/emu_data]
connect_bd_net [get_bd_pins gmax3412_emulator_0/fvalout] [get_bd_pins gmax_capture/emu_fval]
connect_bd_net [get_bd_pins gmax3412_emulator_0/lvalout] [get_bd_pins gmax_capture/emu_lval]
connect_bd_net [get_bd_pins gmax3412_emulator_1/clk_rxg] [get_bd_pins gmax_capture_b/emu_clk]
connect_bd_net [get_bd_pins gmax3412_emulator_1/dataout] [get_bd_pins gmax_capture_b/emu_data]
connect_bd_net [get_bd_pins gmax3412_emulator_1/fvalout] [get_bd_pins gmax_capture_b/emu_fval]
connect_bd_net [get_bd_pins gmax3412_emulator_1/lvalout] [get_bd_pins gmax_capture_b/emu_lval]
connect_bd_net [get_bd_pins gmax_capture_b/status] [get_bd_pins gmax_capture_ctrl_b/gpio2_io_i]
connect_bd_net [get_bd_pins gmax_capture_ctrl_b/gpio_io_o] [get_bd_pins gmax_capture_b/control]
connect_bd_net [get_bd_pins gmax_capture_ctrl/gpio_io_o] [get_bd_pins gmax_capture/control]
connect_bd_net [get_bd_pins gmax_capture/status] [get_bd_pins gmax_capture_ctrl/gpio2_io_i]
connect_bd_net [get_bd_pins gmax_dual_ring_ctrl/gpio_io_o] [get_bd_pins gmax_dual_ring/control]
connect_bd_net [get_bd_pins gmax_dual_ring/readout_pair] [get_bd_pins gmax3412_emulator_0/readout_in] [get_bd_pins gmax3412_emulator_1/readout_in]
connect_bd_net [get_bd_pins gmax_dual_ring/status] [get_bd_pins gmax_dual_ring_ctrl/gpio2_io_i]
connect_bd_net [get_bd_pins gmax_dual_ring/trigger_pair] [get_bd_pins gmax3412_emulator_0/trigger_in] [get_bd_pins gmax3412_emulator_1/trigger_in]
connect_bd_net [get_bd_pins gmax_emu_clock/clk_out1] \
  [get_bd_pins gmax_emu_reset/slowest_sync_clk] [get_bd_pins axi_smc/aclk1] [get_bd_pins gmax_capture_ctrl/s_axi_aclk] \
  [get_bd_pins gmax_capture_dma/s_axi_lite_aclk] [get_bd_pins gmax_capture_dma/m_axi_s2mm_aclk] \
  [get_bd_pins gmax_ddr_smc/aclk] [get_bd_pins zynq_ultra_ps_e_0/saxihp0_fpd_aclk] [get_bd_pins gmax_scheduler/clk] \
  [get_bd_pins gmax_scheduler_ctrl/s_axi_aclk] [get_bd_pins gmax_pl_ring/clk] [get_bd_pins gmax_pl_ring_ctrl/s_axi_aclk] \
  [get_bd_pins pl_ddr_dci_reset/clk] [get_bd_pins gmax_capture_ctrl_b/s_axi_aclk] \
  [get_bd_pins gmax_dual_ring_ctrl/s_axi_aclk] [get_bd_pins gmax_capture_dma_b/s_axi_lite_aclk] \
  [get_bd_pins gmax_capture_dma_b/m_axi_s2mm_aclk] [get_bd_pins gmax_capture/clk] [get_bd_pins gmax_capture_b/clk] \
  [get_bd_pins gmax_capture_b/rx_clk] [get_bd_pins gmax3412_emulator_0/s_axi_aclk] \
  [get_bd_pins gmax3412_emulator_1/s_axi_aclk] [get_bd_pins pl_ddr_smc/aclk1] [get_bd_pins gmax_dual_ring/clk]
connect_bd_net [get_bd_pins gmax_emu_clock/locked] [get_bd_pins gmax_emu_reset/dcm_locked]
connect_bd_net [get_bd_pins gmax_emu_reset/peripheral_aresetn] \
  [get_bd_pins gmax_capture_ctrl/s_axi_aresetn] [get_bd_pins gmax_capture_dma/axi_resetn] [get_bd_pins gmax_ddr_smc/aresetn] \
  [get_bd_pins gmax_scheduler/resetn] [get_bd_pins gmax_scheduler_ctrl/s_axi_aresetn] [get_bd_pins gmax_pl_ring/resetn] \
  [get_bd_pins gmax_pl_ring_ctrl/s_axi_aresetn] [get_bd_pins pl_ddr_dci_reset/resetn] \
  [get_bd_pins gmax_capture_ctrl_b/s_axi_aresetn] [get_bd_pins gmax_dual_ring_ctrl/s_axi_aresetn] \
  [get_bd_pins gmax_capture_dma_b/axi_resetn] [get_bd_pins gmax_capture/resetn] [get_bd_pins gmax_capture_b/resetn] \
  [get_bd_pins gmax3412_emulator_0/s_axi_aresetn] [get_bd_pins gmax3412_emulator_1/s_axi_aresetn] \
  [get_bd_pins gmax_dual_ring/resetn]
connect_bd_net [get_bd_pins gmax_emu_zero/dout] \
  [get_bd_pins gmax_emu_reset/aux_reset_in] [get_bd_pins gmax_emu_reset/mb_debug_sys_rst] \
  [get_bd_pins pl_ddr_reset/mb_debug_sys_rst] [get_bd_pins gmax_capture_b/rx_fval] [get_bd_pins gmax_capture_b/rx_lval] \
  [get_bd_pins gmax3412_emulator_0/init_in] [get_bd_pins gmax3412_emulator_0/acquisition_start] \
  [get_bd_pins gmax3412_emulator_0/acquisition_stop] [get_bd_pins gmax3412_emulator_1/init_in] \
  [get_bd_pins gmax3412_emulator_1/acquisition_start] [get_bd_pins gmax3412_emulator_1/acquisition_stop]
connect_bd_net [get_bd_pins gmax_pl_ring_ctrl/gpio_io_o] [get_bd_pins gmax_pl_ring/control]
connect_bd_net [get_bd_pins gmax_pl_ring/status] [get_bd_pins gmax_pl_ring_ctrl/gpio2_io_i]
connect_bd_net [get_bd_pins gmax_scheduler_ctrl/gpio_io_o] [get_bd_pins gmax_scheduler/control]
connect_bd_net [get_bd_pins gmax_scheduler/status] [get_bd_pins gmax_scheduler_ctrl/gpio2_io_i]
connect_bd_net [get_bd_pins gmax_zero_pixels/dout] [get_bd_pins gmax_capture_b/rx_data]
connect_bd_net [get_bd_pins pl_ddr4/c0_ddr4_ui_clk] [get_bd_pins pl_ddr_reset/slowest_sync_clk] [get_bd_pins pl_ddr_smc/aclk]
connect_bd_net [get_bd_pins pl_ddr4/c0_ddr4_ui_clk_sync_rst] [get_bd_pins pl_ddr_reset/ext_reset_in]
connect_bd_net [get_bd_pins pl_ddr4/c0_init_calib_complete] \
  [get_bd_pins pl_ddr_reset/dcm_locked] [get_bd_pins gmax_pl_ring/calib_ready] [get_bd_pins gmax_dual_ring/calib_ready]
connect_bd_net [get_bd_pins pl_ddr_dci_reset/sys_rst] [get_bd_pins pl_ddr4/sys_rst]
connect_bd_net [get_bd_pins pl_ddr_reset_inactive/dout] [get_bd_pins pl_ddr_reset/aux_reset_in]
connect_bd_net [get_bd_pins pl_ddr_reset/peripheral_aresetn] [get_bd_pins pl_ddr4/c0_ddr4_aresetn] [get_bd_pins pl_ddr_smc/aresetn]
connect_bd_net [get_bd_pins proc_sys_reset_0/interconnect_aresetn] [get_bd_pins axi_gpio_clkmon/s_axi_aresetn] [get_bd_pins ila_0/probe7]
connect_bd_net [get_bd_pins proc_sys_reset_0/peripheral_aresetn] \
  [get_bd_pins axi_smc/aresetn] [get_bd_pins ila_0/probe8] [get_bd_pins fh_pcie_refclk_monit_0/sys_resetn] \
  [get_bd_pins axi_gpio_gmax_a_ctrl/s_axi_aresetn] [get_bd_pins gmax_emu_clock/resetn]
connect_bd_net [get_bd_pins proc_sys_reset_0/peripheral_reset] [get_bd_pins ila_0/probe9]
connect_bd_net [get_bd_pins xlconstant_0/dout] \
  [get_bd_pins proc_sys_reset_0/dcm_locked] [get_bd_pins proc_sys_reset_0/aux_reset_in] [get_bd_pins system_ila_0/resetn] \
  [get_bd_pins axi_iic_gmax_a/s_axi_aresetn]
connect_bd_net [get_bd_pins xlconstant_1/dout] [get_bd_pins proc_sys_reset_0/mb_debug_sys_rst]
connect_bd_net [get_bd_pins zynq_ultra_ps_e_0/emio_i2c1_scl_o] [get_bd_pins ila_0/probe4] [get_bd_pins i2c_emio_iobuf_0/scl_o]
connect_bd_net [get_bd_pins zynq_ultra_ps_e_0/emio_i2c1_scl_t] [get_bd_pins ila_0/probe2] [get_bd_pins i2c_emio_iobuf_0/scl_t]
connect_bd_net [get_bd_pins zynq_ultra_ps_e_0/emio_i2c1_sda_o] [get_bd_pins ila_0/probe5] [get_bd_pins i2c_emio_iobuf_0/sda_o]
connect_bd_net [get_bd_pins zynq_ultra_ps_e_0/emio_i2c1_sda_t] [get_bd_pins ila_0/probe3] [get_bd_pins i2c_emio_iobuf_0/sda_t]
connect_bd_net [get_bd_pins zynq_ultra_ps_e_0/pl_clk0] \
  [get_bd_pins ila_0/clk] [get_bd_pins proc_sys_reset_0/slowest_sync_clk] [get_bd_pins axi_gpio_clkmon/s_axi_aclk] \
  [get_bd_pins axi_smc/aclk] [get_bd_pins zynq_ultra_ps_e_0/maxihpm0_fpd_aclk] [get_bd_pins system_ila_0/clk] \
  [get_bd_pins axi_iic_gmax_a/s_axi_aclk] [get_bd_pins fh_pcie_refclk_monit_0/clk_100m] \
  [get_bd_pins axi_gpio_gmax_a_ctrl/s_axi_aclk] [get_bd_pins gmax_emu_clock/clk_in1]
connect_bd_net [get_bd_pins zynq_ultra_ps_e_0/pl_resetn0] \
  [get_bd_pins proc_sys_reset_0/ext_reset_in] [get_bd_pins ila_0/probe6] [get_bd_pins gmax_emu_reset/ext_reset_in]

# ---- address map ----
assign_bd_address -offset 0x0000000000000000 -range 2G -target_address_space [get_bd_addr_spaces gmax_capture_dma/Data_S2MM] [get_bd_addr_segs zynq_ultra_ps_e_0/SAXIGP2/HP0_DDR_LOW]
assign_bd_address -offset 0x00000000C0000000 -range 512M -target_address_space [get_bd_addr_spaces gmax_capture_dma/Data_S2MM] [get_bd_addr_segs zynq_ultra_ps_e_0/SAXIGP2/HP0_QSPI]
assign_bd_address -offset 0x0000000800000000 -range 2G -target_address_space [get_bd_addr_spaces gmax_capture_dma/Data_S2MM] [get_bd_addr_segs zynq_ultra_ps_e_0/SAXIGP2/HP0_DDR_HIGH]
assign_bd_address -offset 0x0000001000000000 -range 4G -target_address_space [get_bd_addr_spaces gmax_capture_dma/Data_S2MM] [get_bd_addr_segs pl_ddr4/C0_DDR4_MEMORY_MAP/C0_DDR4_ADDRESS_BLOCK]
exclude_bd_addr_seg -offset 0x00000000FF000000 -range 16M -target_address_space [get_bd_addr_spaces gmax_capture_dma/Data_S2MM] [get_bd_addr_segs zynq_ultra_ps_e_0/SAXIGP2/HP0_LPS_OCM]
assign_bd_address -offset 0x0000001000000000 -range 4G -target_address_space [get_bd_addr_spaces gmax_capture_dma_b/Data_S2MM] [get_bd_addr_segs pl_ddr4/C0_DDR4_MEMORY_MAP/C0_DDR4_ADDRESS_BLOCK]
assign_bd_address -offset 0xA0030000 -range 64K -target_address_space [get_bd_addr_spaces gmax_dual_ring/m_axi] [get_bd_addr_segs gmax3412_emulator_0/s_axi/reg0]
assign_bd_address -offset 0xA0040000 -range 64K -target_address_space [get_bd_addr_spaces gmax_dual_ring/m_axi] [get_bd_addr_segs gmax_capture_ctrl/S_AXI/Reg]
assign_bd_address -offset 0xA0050000 -range 64K -target_address_space [get_bd_addr_spaces gmax_dual_ring/m_axi] [get_bd_addr_segs gmax_capture_dma/S_AXI_LITE/Reg]
assign_bd_address -offset 0xA0080000 -range 64K -target_address_space [get_bd_addr_spaces gmax_dual_ring/m_axi] [get_bd_addr_segs gmax3412_emulator_1/s_axi/reg0]
assign_bd_address -offset 0xA0090000 -range 64K -target_address_space [get_bd_addr_spaces gmax_dual_ring/m_axi] [get_bd_addr_segs gmax_capture_ctrl_b/S_AXI/Reg]
assign_bd_address -offset 0xA00A0000 -range 64K -target_address_space [get_bd_addr_spaces gmax_dual_ring/m_axi] [get_bd_addr_segs gmax_capture_dma_b/S_AXI_LITE/Reg]
exclude_bd_addr_seg -offset 0x00000000 -range 1 -target_address_space [get_bd_addr_spaces gmax_dual_ring/m_axi] [get_bd_addr_segs axi_gpio_clkmon/S_AXI/Reg]
exclude_bd_addr_seg -offset 0x00000000 -range 1 -target_address_space [get_bd_addr_spaces gmax_dual_ring/m_axi] [get_bd_addr_segs axi_gpio_gmax_a_ctrl/S_AXI/Reg]
exclude_bd_addr_seg -offset 0x00000000 -range 1 -target_address_space [get_bd_addr_spaces gmax_dual_ring/m_axi] [get_bd_addr_segs axi_iic_gmax_a/S_AXI/Reg]
exclude_bd_addr_seg -offset 0x00000000 -range 1 -target_address_space [get_bd_addr_spaces gmax_dual_ring/m_axi] [get_bd_addr_segs gmax_dual_ring_ctrl/S_AXI/Reg]
exclude_bd_addr_seg -offset 0x00000000 -range 1 -target_address_space [get_bd_addr_spaces gmax_dual_ring/m_axi] [get_bd_addr_segs gmax_pl_ring_ctrl/S_AXI/Reg]
exclude_bd_addr_seg -offset 0x00000000 -range 1 -target_address_space [get_bd_addr_spaces gmax_dual_ring/m_axi] [get_bd_addr_segs gmax_scheduler_ctrl/S_AXI/Reg]
exclude_bd_addr_seg -offset 0x00000000 -range 1 -target_address_space [get_bd_addr_spaces gmax_dual_ring/m_axi] [get_bd_addr_segs pl_ddr4/C0_DDR4_MEMORY_MAP/C0_DDR4_ADDRESS_BLOCK]
assign_bd_address -offset 0xA0030000 -range 64K -target_address_space [get_bd_addr_spaces gmax_pl_ring/m_axi] [get_bd_addr_segs gmax3412_emulator_0/s_axi/reg0]
assign_bd_address -offset 0xA0040000 -range 64K -target_address_space [get_bd_addr_spaces gmax_pl_ring/m_axi] [get_bd_addr_segs gmax_capture_ctrl/S_AXI/Reg]
assign_bd_address -offset 0xA0050000 -range 64K -target_address_space [get_bd_addr_spaces gmax_pl_ring/m_axi] [get_bd_addr_segs gmax_capture_dma/S_AXI_LITE/Reg]
exclude_bd_addr_seg -offset 0x00000000 -range 1 -target_address_space [get_bd_addr_spaces gmax_pl_ring/m_axi] [get_bd_addr_segs axi_gpio_clkmon/S_AXI/Reg]
exclude_bd_addr_seg -offset 0x00000000 -range 1 -target_address_space [get_bd_addr_spaces gmax_pl_ring/m_axi] [get_bd_addr_segs axi_gpio_gmax_a_ctrl/S_AXI/Reg]
exclude_bd_addr_seg -offset 0x00000000 -range 1 -target_address_space [get_bd_addr_spaces gmax_pl_ring/m_axi] [get_bd_addr_segs axi_iic_gmax_a/S_AXI/Reg]
exclude_bd_addr_seg -offset 0x00000000 -range 1 -target_address_space [get_bd_addr_spaces gmax_pl_ring/m_axi] [get_bd_addr_segs gmax3412_emulator_1/s_axi/reg0]
exclude_bd_addr_seg -offset 0x00000000 -range 1 -target_address_space [get_bd_addr_spaces gmax_pl_ring/m_axi] [get_bd_addr_segs gmax_capture_ctrl_b/S_AXI/Reg]
exclude_bd_addr_seg -offset 0x00000000 -range 1 -target_address_space [get_bd_addr_spaces gmax_pl_ring/m_axi] [get_bd_addr_segs gmax_capture_dma_b/S_AXI_LITE/Reg]
exclude_bd_addr_seg -offset 0x00000000 -range 1 -target_address_space [get_bd_addr_spaces gmax_pl_ring/m_axi] [get_bd_addr_segs gmax_dual_ring_ctrl/S_AXI/Reg]
exclude_bd_addr_seg -offset 0x00000000 -range 1 -target_address_space [get_bd_addr_spaces gmax_pl_ring/m_axi] [get_bd_addr_segs gmax_pl_ring_ctrl/S_AXI/Reg]
exclude_bd_addr_seg -offset 0x00000000 -range 1 -target_address_space [get_bd_addr_spaces gmax_pl_ring/m_axi] [get_bd_addr_segs gmax_scheduler_ctrl/S_AXI/Reg]
exclude_bd_addr_seg -offset 0x00000000 -range 1 -target_address_space [get_bd_addr_spaces gmax_pl_ring/m_axi] [get_bd_addr_segs pl_ddr4/C0_DDR4_MEMORY_MAP/C0_DDR4_ADDRESS_BLOCK]
assign_bd_address -offset 0xA0000000 -range 64K -target_address_space [get_bd_addr_spaces gmax_scheduler/m_axi] [get_bd_addr_segs axi_gpio_clkmon/S_AXI/Reg]
assign_bd_address -offset 0xA0010000 -range 64K -target_address_space [get_bd_addr_spaces gmax_scheduler/m_axi] [get_bd_addr_segs axi_gpio_gmax_a_ctrl/S_AXI/Reg]
assign_bd_address -offset 0xA0020000 -range 64K -target_address_space [get_bd_addr_spaces gmax_scheduler/m_axi] [get_bd_addr_segs axi_iic_gmax_a/S_AXI/Reg]
assign_bd_address -offset 0xA0030000 -range 64K -target_address_space [get_bd_addr_spaces gmax_scheduler/m_axi] [get_bd_addr_segs gmax3412_emulator_0/s_axi/reg0]
assign_bd_address -offset 0xA0040000 -range 64K -target_address_space [get_bd_addr_spaces gmax_scheduler/m_axi] [get_bd_addr_segs gmax_capture_ctrl/S_AXI/Reg]
assign_bd_address -offset 0xA0050000 -range 64K -target_address_space [get_bd_addr_spaces gmax_scheduler/m_axi] [get_bd_addr_segs gmax_capture_dma/S_AXI_LITE/Reg]
assign_bd_address -offset 0xA0060000 -range 64K -target_address_space [get_bd_addr_spaces gmax_scheduler/m_axi] [get_bd_addr_segs gmax_scheduler_ctrl/S_AXI/Reg]
exclude_bd_addr_seg -offset 0x00000000 -range 1 -target_address_space [get_bd_addr_spaces gmax_scheduler/m_axi] [get_bd_addr_segs gmax3412_emulator_1/s_axi/reg0]
exclude_bd_addr_seg -offset 0x00000000 -range 1 -target_address_space [get_bd_addr_spaces gmax_scheduler/m_axi] [get_bd_addr_segs gmax_capture_ctrl_b/S_AXI/Reg]
exclude_bd_addr_seg -offset 0x00000000 -range 1 -target_address_space [get_bd_addr_spaces gmax_scheduler/m_axi] [get_bd_addr_segs gmax_capture_dma_b/S_AXI_LITE/Reg]
exclude_bd_addr_seg -offset 0x00000000 -range 1 -target_address_space [get_bd_addr_spaces gmax_scheduler/m_axi] [get_bd_addr_segs gmax_dual_ring_ctrl/S_AXI/Reg]
exclude_bd_addr_seg -offset 0x00000000 -range 1 -target_address_space [get_bd_addr_spaces gmax_scheduler/m_axi] [get_bd_addr_segs gmax_pl_ring_ctrl/S_AXI/Reg]
exclude_bd_addr_seg -offset 0x00000000 -range 1 -target_address_space [get_bd_addr_spaces gmax_scheduler/m_axi] [get_bd_addr_segs pl_ddr4/C0_DDR4_MEMORY_MAP/C0_DDR4_ADDRESS_BLOCK]
assign_bd_address -offset 0x00A0000000 -range 64K -target_address_space [get_bd_addr_spaces zynq_ultra_ps_e_0/Data] [get_bd_addr_segs axi_gpio_clkmon/S_AXI/Reg]
assign_bd_address -offset 0x00A0010000 -range 64K -target_address_space [get_bd_addr_spaces zynq_ultra_ps_e_0/Data] [get_bd_addr_segs axi_gpio_gmax_a_ctrl/S_AXI/Reg]
assign_bd_address -offset 0x00A0020000 -range 64K -target_address_space [get_bd_addr_spaces zynq_ultra_ps_e_0/Data] [get_bd_addr_segs axi_iic_gmax_a/S_AXI/Reg]
assign_bd_address -offset 0x00A0030000 -range 64K -target_address_space [get_bd_addr_spaces zynq_ultra_ps_e_0/Data] [get_bd_addr_segs gmax3412_emulator_0/s_axi/reg0]
assign_bd_address -offset 0x00A0040000 -range 64K -target_address_space [get_bd_addr_spaces zynq_ultra_ps_e_0/Data] [get_bd_addr_segs gmax_capture_ctrl/S_AXI/Reg]
assign_bd_address -offset 0x00A0050000 -range 64K -target_address_space [get_bd_addr_spaces zynq_ultra_ps_e_0/Data] [get_bd_addr_segs gmax_capture_dma/S_AXI_LITE/Reg]
assign_bd_address -offset 0x00A0060000 -range 64K -target_address_space [get_bd_addr_spaces zynq_ultra_ps_e_0/Data] [get_bd_addr_segs gmax_scheduler_ctrl/S_AXI/Reg]
assign_bd_address -offset 0x00A0070000 -range 64K -target_address_space [get_bd_addr_spaces zynq_ultra_ps_e_0/Data] [get_bd_addr_segs gmax_pl_ring_ctrl/S_AXI/Reg]
assign_bd_address -offset 0x00A0080000 -range 64K -target_address_space [get_bd_addr_spaces zynq_ultra_ps_e_0/Data] [get_bd_addr_segs gmax3412_emulator_1/s_axi/reg0]
assign_bd_address -offset 0x00A0090000 -range 64K -target_address_space [get_bd_addr_spaces zynq_ultra_ps_e_0/Data] [get_bd_addr_segs gmax_capture_ctrl_b/S_AXI/Reg]
assign_bd_address -offset 0x00A00A0000 -range 64K -target_address_space [get_bd_addr_spaces zynq_ultra_ps_e_0/Data] [get_bd_addr_segs gmax_capture_dma_b/S_AXI_LITE/Reg]
assign_bd_address -offset 0x00A00B0000 -range 64K -target_address_space [get_bd_addr_spaces zynq_ultra_ps_e_0/Data] [get_bd_addr_segs gmax_dual_ring_ctrl/S_AXI/Reg]
assign_bd_address -offset 0x1000000000 -range 4G -target_address_space [get_bd_addr_spaces zynq_ultra_ps_e_0/Data] [get_bd_addr_segs pl_ddr4/C0_DDR4_MEMORY_MAP/C0_DDR4_ADDRESS_BLOCK]

validate_bd_design
save_bd_design
